# EAGLE schematic Assignment 1_v3b_electronic_siren (EAGLE 9.6.2)
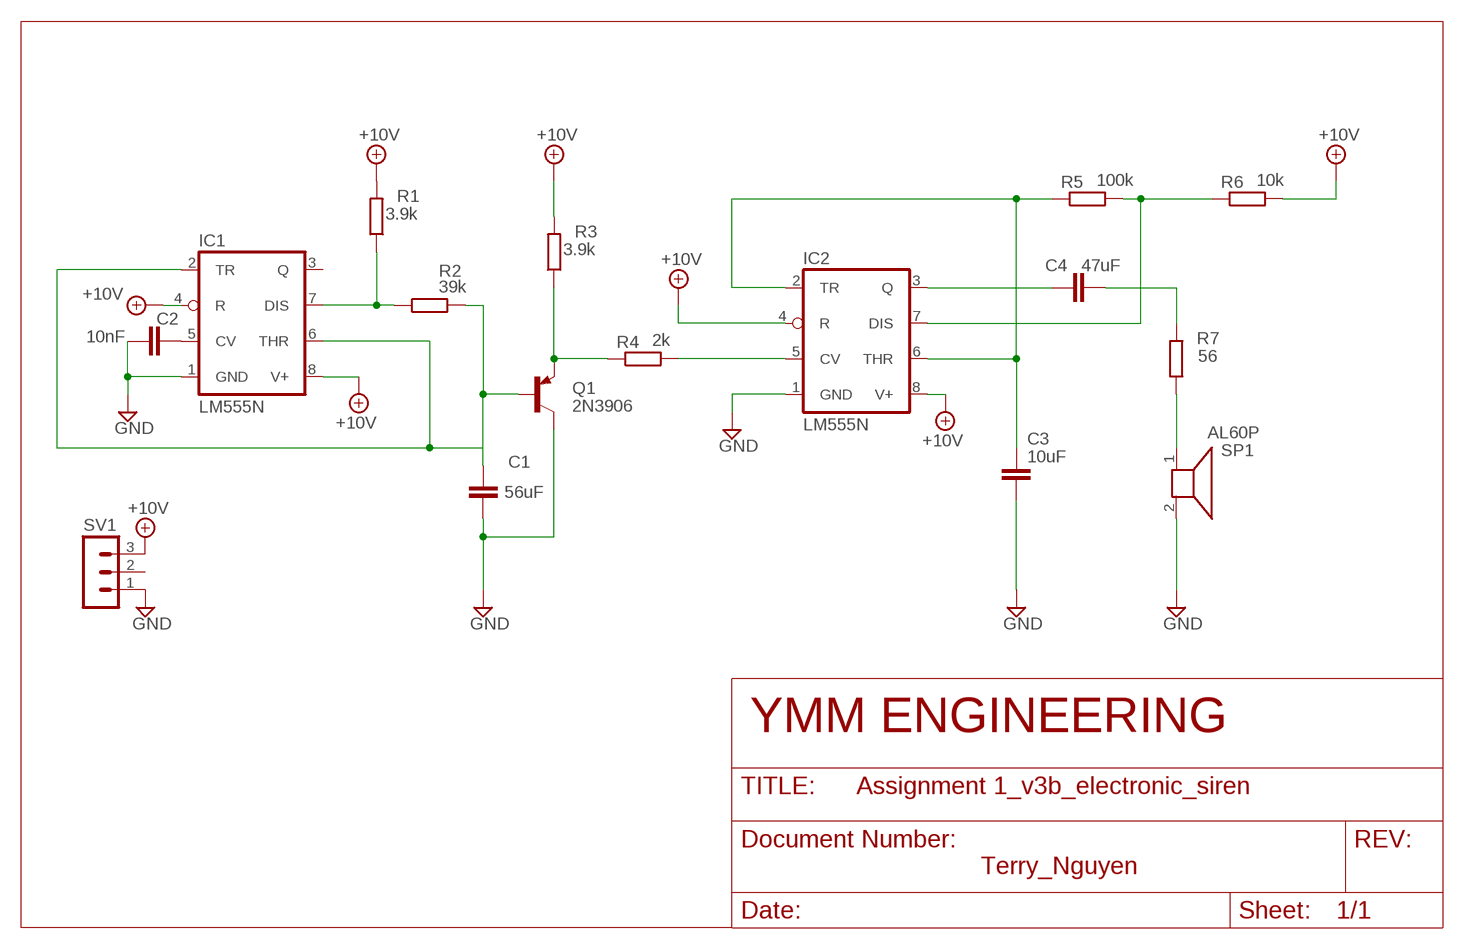
[diagram p0: schematic, sheet 1]

## Parts
C1  56uF  C-EU050-024X044  [C050-024X044]
C2  10nF  C-EU050-024X044  [C050-024X044]
C3  10uF  C-EU050-024X044  [C050-024X044]
C4  47uF  C-EU050-024X044  [C050-024X044]
IC1  LM555N  [DIL08]
IC2  LM555N  [DIL08]
Q1  2N3906  [TO92]
R1  3.9k  R-EU_0309/10  [0309/10]
R2  39k  R-EU_0309/10  [0309/10]
R3  3.9k  R-EU_0309/10  [0309/10]
R4  2k  R-EU_0309/10  [0309/10]
R5  100k  R-EU_0309/10  [0309/10]
R6  10k  R-EU_0309/10  [0309/10]
R7  56  R-EU_0309/10  [0309/10]
SP1  AL60P  [AL60P]
SV1  MA03-1  [MA03-1]

## Nets
+10V: IC1.4(R) IC1.8(V+) IC2.4(R) IC2.8(V+) R1.2 R3.2 R6.2 SV1.3
GND: C1.1 C2.1 C3.2 IC1.1(GND) IC2.1(GND) Q1.1(C) SP1.2 SV1.1
N$1: C2.2 IC1.5(CV)
N$3: IC1.7(DIS) R1.1 R2.1
N$4: C3.1 IC2.2(TR) IC2.6(THR) R5.1
N$5: Q1.3(E) R3.1 R4.1
N$6: IC2.5(CV) R4.2
N$7: C4.1 IC2.3(Q)
N$8: R7.1 SP1.1
N$9: C4.2 R7.2
N$10: IC2.7(DIS) R5.2 R6.1
N$11: C1.2 IC1.2(TR) IC1.6(THR) Q1.2(B) R2.2
Unconnected: IC1.3(Q) SV1.2

## Notes on the sheet
- YMM ENGINEERING
- Terry_Nguyen

## Library data of the parts
C1-C4 = rcl:C-EU: CAPACITOR, European symbol; SPICEPREFIX: C
IC1 IC2 = linear:*555: TIMER
Q1 = transistor-pnp:2N3906: PNP Transistor
R1-R7 = rcl:R-EU_: RESISTOR, European symbol; SPICEPREFIX: R
SP1 = buzzer:AL60P: SPEAKER Source: Buerklin; OC_FARNELL: unknown; OC_NEWARK: unknown
SV1 = con-lstb:MA03-1: PIN HEADER; OC_FARNELL: unknown; OC_NEWARK: unknown